# Altium schematic sheet buzzer.SchDoc
size A3; SheetNumber: 13; SheetTotal: 18; SPICEModelCacheMSYVYFRR: <root> / <DocumentId>MSYVYFRR</DocumentId> / <CacheFrame Number="0"> / <Model Name="nmos" Kind="MDL"> / <Text>*Default N-Channel MOSFET / *Pinout: D,G,S / .MODEL NMOS NMOS()</Text> / </Model> / </CacheFrame> / </root>
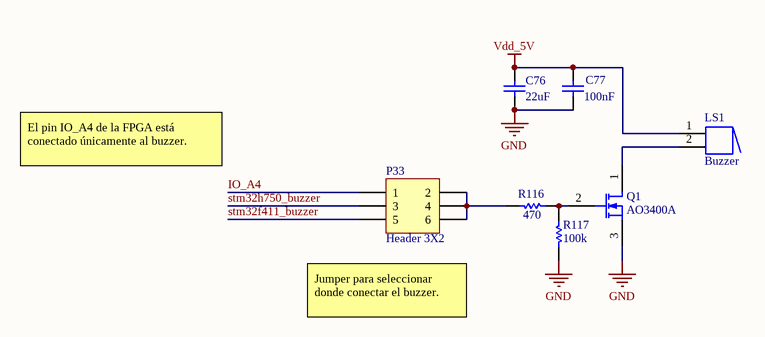
[diagram p0: buzzer.SchDoc]

## Parts
C76  value 22uF  [capacitor 0603]  (hidden comment: ceramic capacitor)
C77  value 100nF  [capacitor 0805]  (hidden comment: ceramic capacitor)
LS1  Buzzer  [Buzzer 12mm x 8.25mm - 6.5mm pitch]
P33  Header 3X2  [HDR2X3]
Q1  AO3400A  [sot-23]
R116  value 470  [resistor 0603]  (hidden comment: resistor)
R117  value 100k  [resistor 0603]  (hidden comment: resistor)

## Nets
GND: C76.1 C77.2 Q1.3(S) R117.2
Vdd_5V: C76.2 C77.1 LS1.1
IO_A4: P33.1
stm32f411_buzzer: P33.5
stm32h750_buzzer: P33.3
NetLS1_2: LS1.2 Q1.1(D)
NetP33_2: P33.2 P33.4 P33.6 R116.1
NetQ1_2: Q1.2(G) R116.2 R117.1

## Notes on the sheet
- El pin IO_A4 de la FPGA está conectado únicamente al buzzer.
- (near P33) Jumper para seleccionar donde conectar el buzzer.

## Library data of the parts
C76 = ceramic capacitor: Multilayer ceramic capacitor; V: 6.3; LCSC part: C59461; Package: 0603
C77 = ceramic capacitor: Multilayer ceramic capacitor; V: 50; LCSC part: C1711; Package: 0805
LS1 = Buzzer: Magnetic Transducer Buzzer; pin to pad: 1A>none 2A>none; Published: 24-Mar-1999; LatestRevisionDate: 17-Dec-2003; LatestRevisionNote: Schematic revised, PCB Footprint replaced.; DatasheetVersion: 17-Dec-2003; PackageReference: ABSM-1574; Publisher: Altium Limited; PackageDescription: Magnetic Transducer Buzzer; ComponentLink1Description: Manufacturer Link; ComponentLink1URL: http://www.megastar.com/linecard/buzzmode/index.php
P33 = Header 3X2: Header, 3-Pin, Dual row; LatestRevisionDate: 17-Jul-2002; LatestRevisionNote: Re-released for DXP Platform.; Publisher: Altium Limited
Q1 = MOSFET-N: N-Channel MOSFET; pin to pad: 1>3 2>1 3>2; MFR: Alpha & Omega Semicon; Package: SOT-23-3L; LCSC part: C20917; MFR part: AO3400A
R116 R117 = resistor: Package: 0603